# EasyEDA schematic sunrise_alarm_pcb.json
TITLE: Sunrise Alarm PCB; REV: 1.0; Date: 2026-10-03; Sheet: 1/1; Drawn By: Michael Murdock
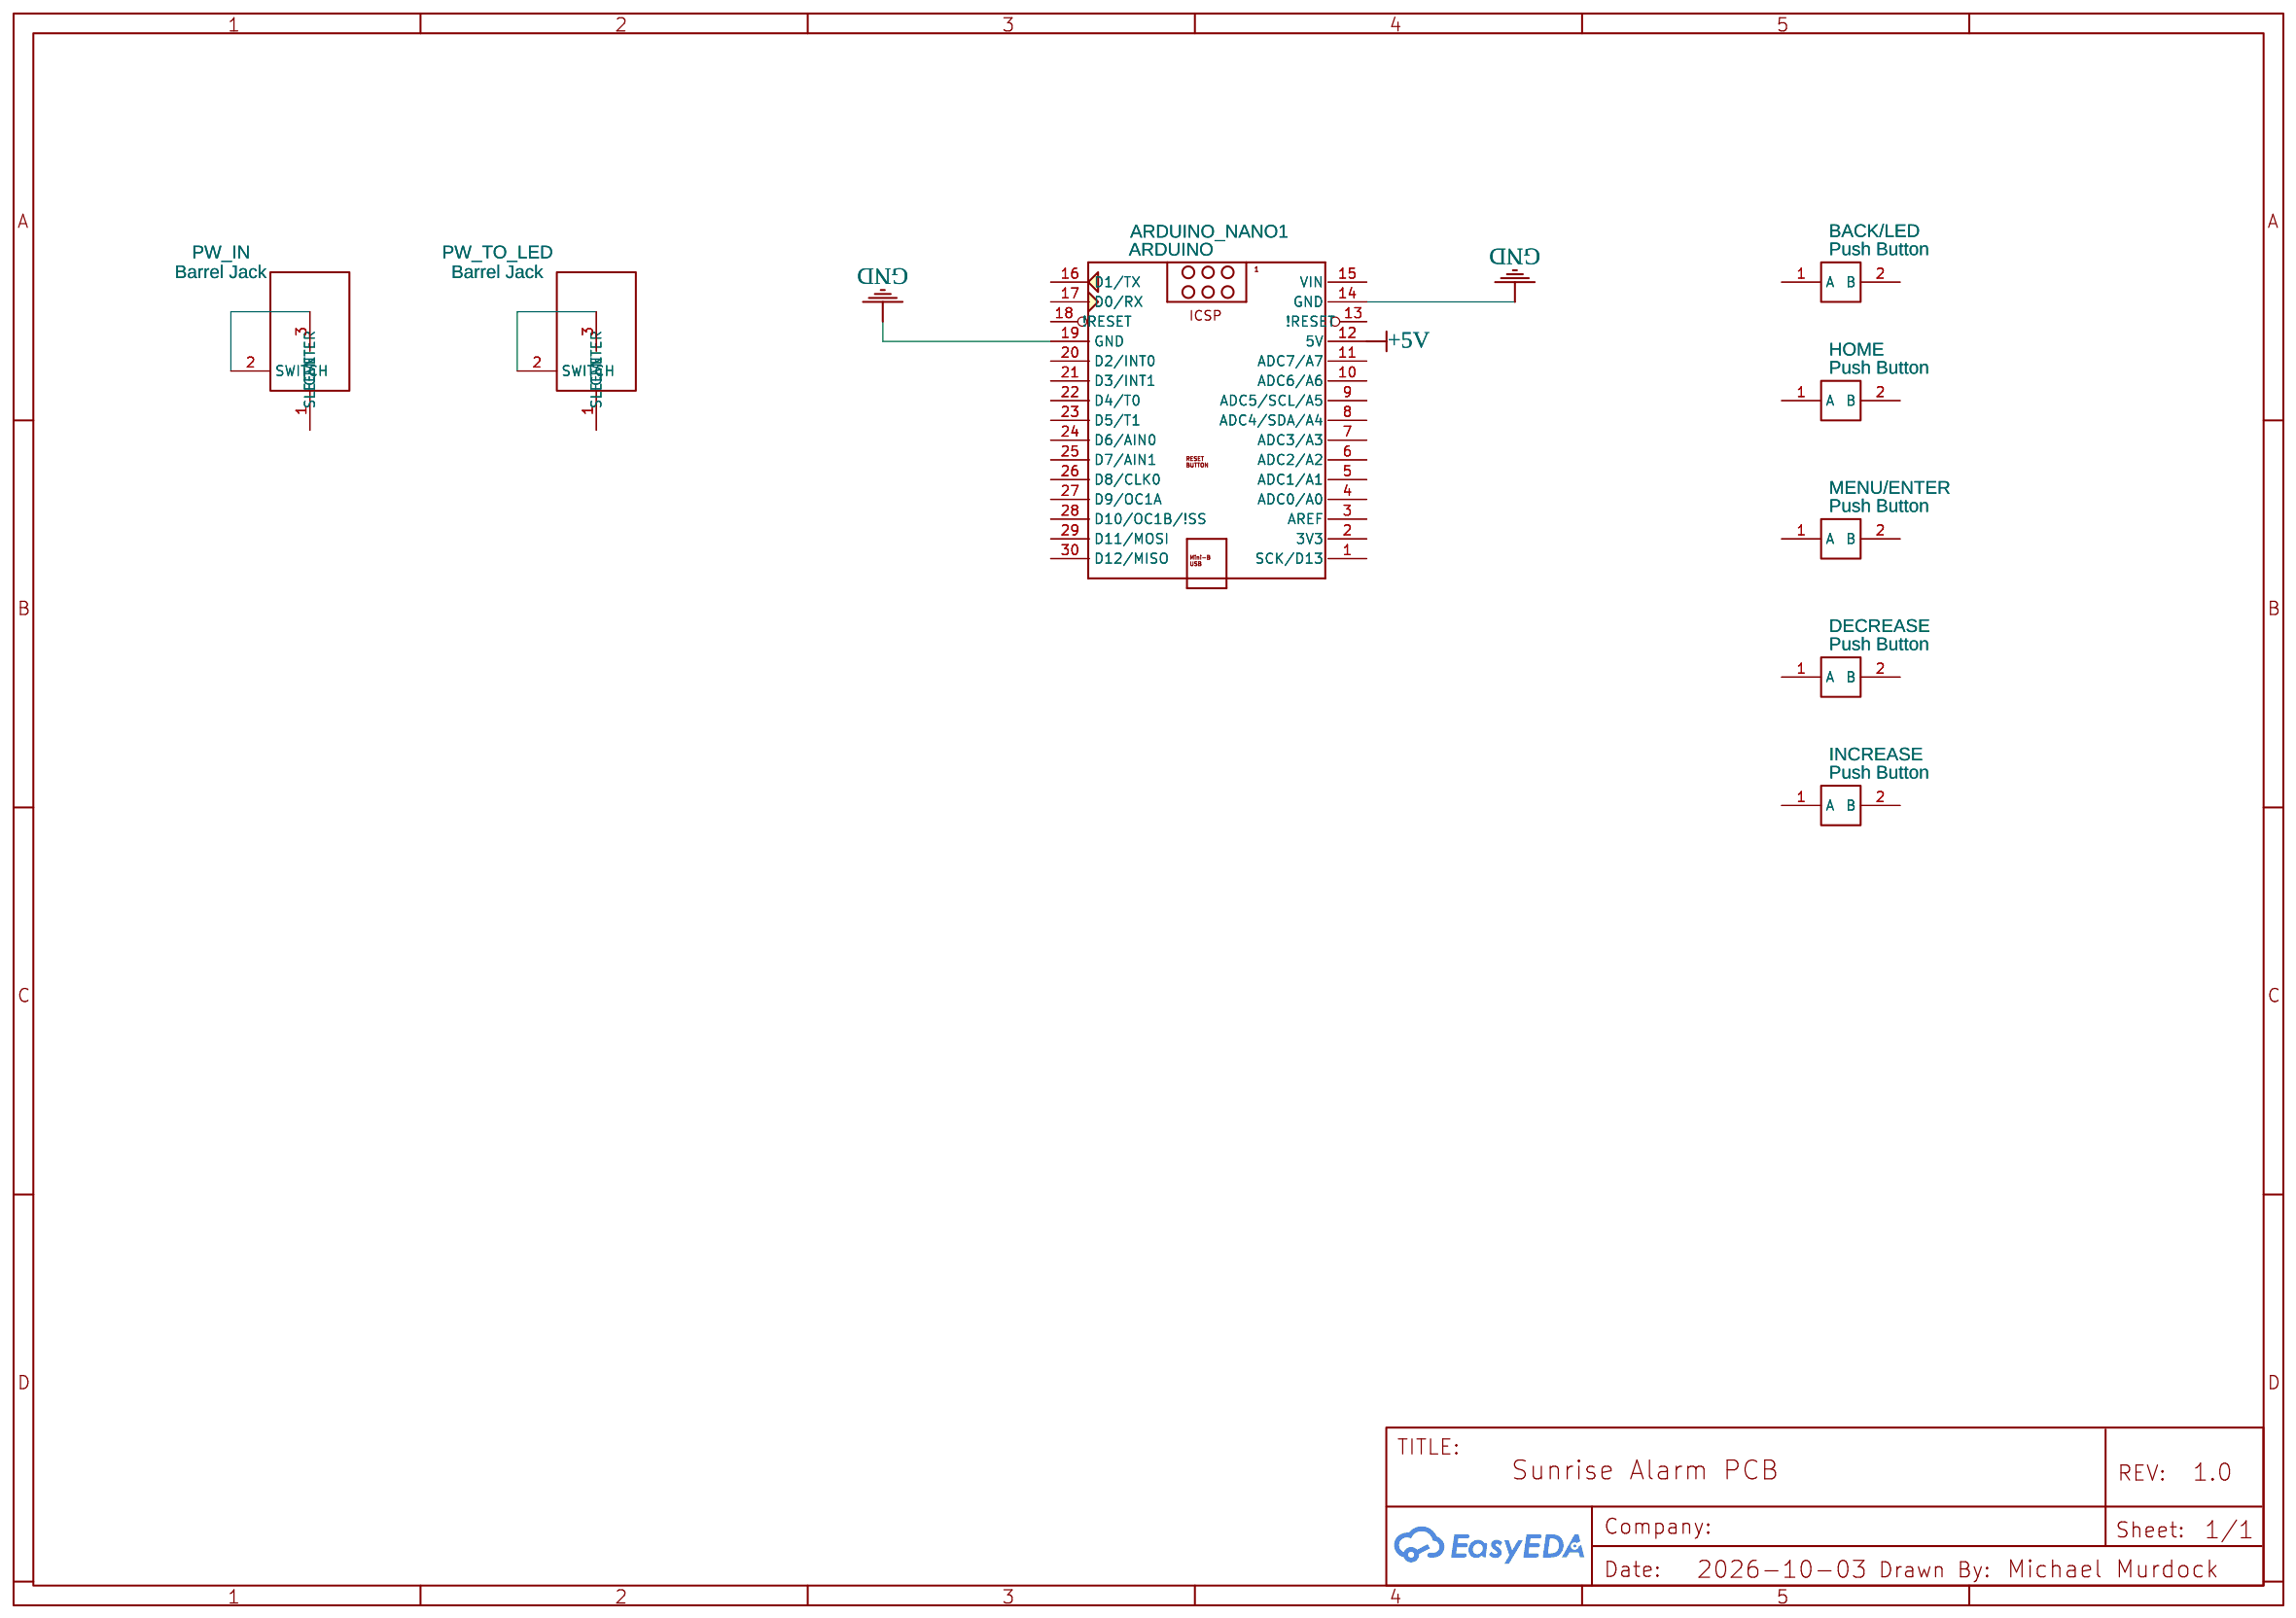
[diagram p0: schematic sheet]

## Parts
ARDUINO_NANO1  ARDUINO  [ARDUINONANOV30_ARDUINO_NANO]
BACK/LED  Push Button
DECREASE  Push Button
HOME  Push Button
INCREASE  Push Button
MENU/ENTER  Push Button
PW_IN  Barrel Jack
PW_TO_LED  Barrel Jack

## Library data of the parts
ARDUINO_NANO1 = ARDUINO: Package Display: No
BACK/LED DECREASE HOME INCREASE MENU/ENTER = Push Button: Contributor: mmurdock13000
PW_IN = Barrel Jack: Contributor: mmurdock13000
PW_TO_LED = Barrel Jack: Contributor: mmurdock13000; Package Display: No

## Nets
+5V: ARDUINO_NANO1.12(5V)
GND: ARDUINO_NANO1.14(GND) ARDUINO_NANO1.19(GND)
Net-(PW_IN-2): PW_IN.2(SWITCH) PW_IN.3(SLEEVE)
Net-(PW_TO_LED-2): PW_TO_LED.2(SWITCH) PW_TO_LED.3(SLEEVE)

Not connected (* = marked no-connect by the designer): ARDUINO_NANO1 1(SCK/D13) 2(3V3) 3(AREF) 4(ADC0/A0) 5(ADC1/A1) 6(ADC2/A2) 7(ADC3/A3) 8(ADC4/SDA/A4) 9(ADC5/SCL/A5) 10(ADC6/A6) 11(ADC7/A7) 13(!RESET) 15(VIN) 16(D1/TX) 17(D0/RX) 18(!RESET) 20(D2/INT0) 21(D3/INT1) 22(D4/T0) 23(D5/T1) 24(D6/AIN0) 25(D7/AIN1) 26(D8/CLK0) 27(D9/OC1A) 28(D10/OC1B/!SS) 29(D11/MOSI) 30(D12/MISO); BACK/LED 1(A) 2(B); DECREASE 1(A) 2(B); HOME 1(A) 2(B); INCREASE 1(A) 2(B); MENU/ENTER 1(A) 2(B); PW_IN 1(CENTER); PW_TO_LED 1(CENTER)
